# Altium schematic sheet POWER_PMIC_RK809_LDO.SchDoc
size A4; SheetNumber: 6; SheetTotal: 25
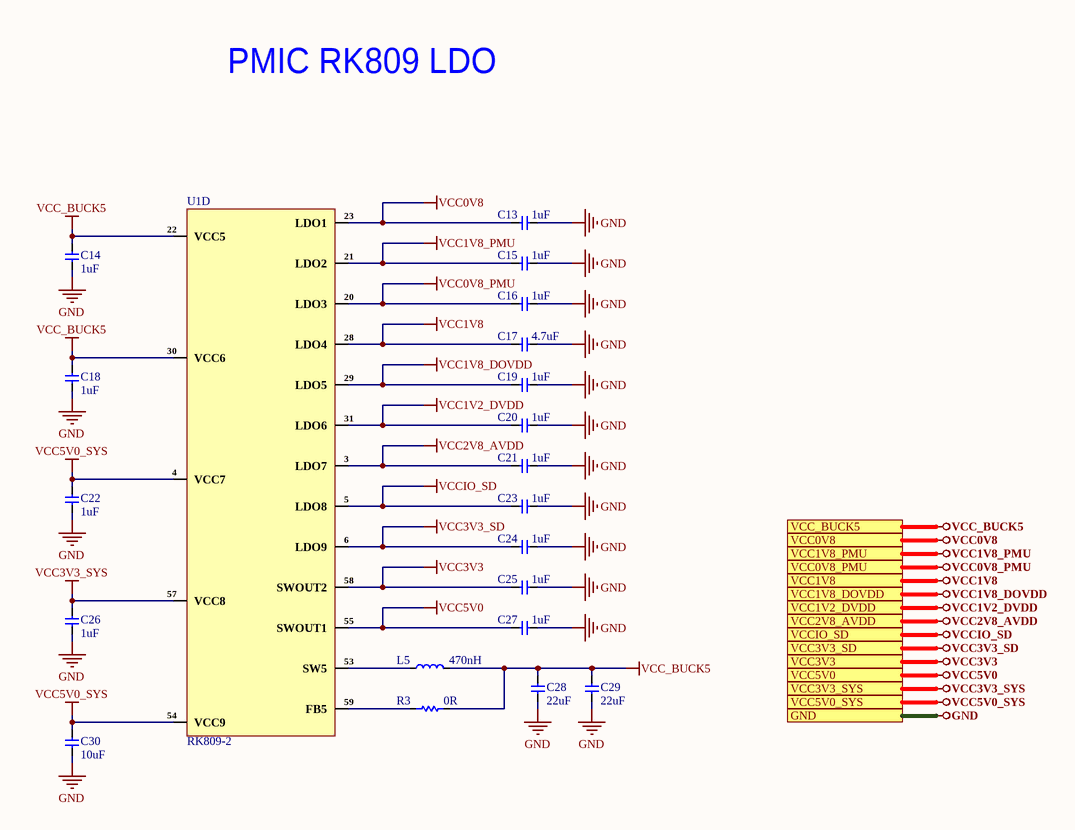
[diagram p0: POWER_PMIC_RK809_LDO.SchDoc]

## Parts
C13  1uF  [Cap-0402]
C14  1uF  [Cap-0402]
C15  1uF  [Cap-0402]
C16  1uF  [Cap-0402]
C17  4.7uF  [Cap-0402]
C18  1uF  [Cap-0402]
C19  1uF  [Cap-0402]
C20  1uF  [Cap-0402]
C21  1uF  [Cap-0402]
C22  1uF  [Cap-0402]
C23  1uF  [Cap-0402]
C24  1uF  [Cap-0402]
C25  1uF  [Cap-0402]
C26  1uF  [Cap-0402]
C27  1uF  [Cap-0402]
C28  22uF  [Cap-0603]
C29  22uF  [Cap-0603]
C30  10uF  [Cap-0603]
L5  470nH  [YHNR3012-R47M]
R3  0R  [Res-0402]
U1  RK809-2  [68-QFN-(7x7)]  (part D of 4)

## Ports
GND (see DDR3_SDRAM_INTERFACE[4D], DIGITAL_MEMS_MIC_INTERFACE[3D], eMMC_INTERFACE[3D], ETHERNET_SWITCH_INTERFACE[5C], IR-CUT_LIGHT SENSOR_SHEET[3D], MIPI TO HDMI_MODULE_INTERFACE[3D], MIPI-CSI_RXX_INTERFACE[4C], PoE PD INTERFACE[3D], PoE_PSE_CONTROLLER[5D], POWER_LDO_SHEET[3D], POWER_PMIC_RK809_CODEC[3D], POWER_PMIC_RK809_DC DC[3D], POWER_PMIC_RK809_MANAGEMENT[3D], RV1126_AUDIO_SHEET[3D], RV1126_DRAM_SHEET[4C], RV1126_eMMC_SPI-FLASH_SHEET[3D], RV1126_ETHERNET_SHEET[3D], RV1126_OSC-PLL-PMUIO[3C], RV1126_POWER_SHEET[1D], RV1126_SARADC_SHEET[3C], SPI_FLASH_INTERFACE[3D], SYNCHRONOUS _BUCK_CONTROLLER[3D], USB2.0_DEBUG_UART[3D], WIFI_AP6256_SHEET[4D]), VCC0V8 (see MIPI TO HDMI_MODULE_INTERFACE[3D], MIPI-CSI_RXX_INTERFACE[4C], USB2.0_DEBUG_UART[3D]), VCC0V8_PMU, VCC1V2_DVDD (see MIPI-CSI_RXX_INTERFACE[4C]), VCC1V8 (see DIGITAL_MEMS_MIC_INTERFACE[3D], IR-CUT_LIGHT SENSOR_SHEET[3D], MIPI TO HDMI_MODULE_INTERFACE[3D], MIPI-CSI_RXX_INTERFACE[4C], POWER_PMIC_RK809_MANAGEMENT[3D], RV1126_AUDIO_SHEET[3D], RV1126_ETHERNET_SHEET[3D], RV1126_OSC-PLL-PMUIO[3C], RV1126_SARADC_SHEET[3C], USB2.0_DEBUG_UART[3D], WIFI_AP6256_SHEET[4D]), VCC1V8_DOVDD (see MIPI-CSI_RXX_INTERFACE[4C]), VCC1V8_PMU (see POWER_PMIC_RK809_MANAGEMENT[3D], RV1126_OSC-PLL-PMUIO[3C]), VCC2V8_AVDD (see MIPI-CSI_RXX_INTERFACE[4C]), VCC3V3 (see RV1126_ETHERNET_SHEET[3D], RV1126_SARADC_SHEET[3C], USB2.0_DEBUG_UART[3D], WIFI_AP6256_SHEET[4D]), VCC3V3_SD, VCC3V3_SYS (see MIPI TO HDMI_MODULE_INTERFACE[3D], POWER_PMIC_RK809_DC DC[3D], POWER_PMIC_RK809_MANAGEMENT[3D], RV1126_eMMC_SPI-FLASH_SHEET[3D], RV1126_OSC-PLL-PMUIO[3C], WIFI_AP6256_SHEET[4D]), VCC5V0, VCC5V0_SYS (see IR-CUT_LIGHT SENSOR_SHEET[3D], MIPI TO HDMI_MODULE_INTERFACE[3D], POWER_LDO_SHEET[3D], POWER_PMIC_RK809_CODEC[3D], POWER_PMIC_RK809_DC DC[3D], POWER_PMIC_RK809_MANAGEMENT[3D], RV1126_OSC-PLL-PMUIO[3C], SYNCHRONOUS _BUCK_CONTROLLER[3D], USB2.0_DEBUG_UART[3D]), VCC_BUCK5 (see POWER_LDO_SHEET[3D]), VCCIO_SD (see RV1126_eMMC_SPI-FLASH_SHEET[3D])

## Nets
GND: C13.1 C14.1 C15.1 C16.1 C17.1 C18.1 C19.1 C20.1 C21.1 C22.1 C23.1 C24.1 C25.1 C26.1 C27.1 C28.1 C29.1 C30.1 ; port GND
VCC0V8: C13.2 U1.23(LDO1) ; port VCC0V8
VCC0V8_PMU: C16.2 U1.20(LDO3) ; port VCC0V8_PMU
VCC1V2_DVDD: C20.2 U1.31(LDO6) ; port VCC1V2_DVDD
VCC1V8: C17.2 U1.28(LDO4) ; port VCC1V8
VCC1V8_DOVDD: C19.2 U1.29(LDO5) ; port VCC1V8_DOVDD
VCC1V8_PMU: C15.2 U1.21(LDO2) ; port VCC1V8_PMU
VCC2V8_AVDD: C21.2 U1.3(LDO7) ; port VCC2V8_AVDD
VCC3V3: C25.2 U1.58(SWOUT2) ; port VCC3V3
VCC3V3_SD: C24.2 U1.6(LDO9) ; port VCC3V3_SD
VCC3V3_SYS: C26.2 U1.57(VCC8) ; port VCC3V3_SYS
VCC5V0: C27.2 U1.55(SWOUT1) ; port VCC5V0
VCC5V0_SYS: C22.2 C30.2 U1.4(VCC7) U1.54(VCC9) ; port VCC5V0_SYS
VCC_BUCK5: C14.2 C18.2 C28.2 C29.2 L5.2 R3.2 U1.22(VCC5) U1.30(VCC6) ; port VCC_BUCK5
VCCIO_SD: C23.2 U1.5(LDO8) ; port VCCIO_SD
NetL5_1: L5.1 U1.53(SW5)
NetR3_1: R3.1 U1.59(FB5)

## Notes on the sheet
- PMIC RK809 LDO
- File:
- Title:
- Date:
- Page
- Num:
- Total:
- Drawn By: Huzaifa Ali

## Library data of the parts
C13-C16 C18-C27 = CC0402KRX5R6BB105: CAP CER 1UF 10V X5R 0402; Manufacturer: Yageo; Tolerance: 10%; Dissipation Factor: 15%; Item Type: Capacitor; Supplier 1: Mouser; Manufacturer Part Number: CC0402KRX5R6BB105; RoHS: Yes; Category: Ceramic Capacitors; Stock 1: 6711367; Pricing 1: 1=0.11000, 10=0.05500, 50=0.05500, 100=0.03300, 500=0.02700, 1000=0.02200, 2500=0.02100, 10000=0.01800 (USD); Mount: Surface Mount; Case/Package: 0402; Number of Pins: 2; Case Code (Metric): 1005; Case Code (Imperial): 0402; Min Operating Temperature: -55°C; Max Operating Temperature: 85°C; Capacitance: 1uF; Dielectric: X5R; Package Quantity: 1; Voltage Rating: 10V; Packaging: Tape and Reel; Voltage Rating (DC): 10V; Termination: SMD/SMT; Resistor Type: Ceramic; Series: CC; Construction: Flat; Length: 1mm; Width: 0.02inch; Height: 0.5mm; Thickness: 0.022inch; Depth: 0.5mm; Radiation Hardening: No; REACH SVHC: No SVHC; Lead Free: Lead Free; Halogen Free: Halogen Free; RoHS Compliant: Yes; ComponentLink1URL: https://datasheet.ciiva.com/176/upy-gphc-x5r-4v-to-50v-12-176704.pdf?src-supplier=Digi-Key; ComponentLink1Description: https://datasheet.ciiva.com/176/upy-gphc-x5r-4v-to-50v-12-176704.pdf?src-supplier=Digi-Key; ComponentLink2URL: https://datasheet.ciiva.com/176/mlccorderingcode-176705.pdf?src-supplier=Digi-Key; ComponentLink2Description: https://datasheet.ciiva.com/176/mlccorderingcode-176705.pdf?src-supplier=Digi-Key; ComponentLink3URL: https://datasheet.ciiva.com/176/mlccorderingcode-176706.pdf?src-supplier=Digi-Key; ComponentLink3Description: https://datasheet.ciiva.com/176/mlccorderingcode-176706.pdf?src-supplier=Digi-Key; Supplier Part Number 1: 603-CC402KRX5R6BB105; LCSC Part Number: C106254
C17 = CC0402KRX5R5BB475: CAP CER 4.7UF 6.3V X5R 0402; Manufacturer: Yageo; Tolerance: 10%; Item Type: Capacitor; Supplier 1: Arrow Electronics; Manufacturer Part Number: CC0402KRX5R5BB475; RoHS: Yes; Category: Ceramic Capacitors; Stock 1: 890000; Pricing 1: 10000=0.02120, 20000=0.02030, 30000=0.02010, 50000=0.01930, 100000=0.01760, 250000=0.01630 (USD); Case/Package: 0402; Voltage Rating (DC): 6.3V; Dielectric: X5R; Capacitance: 4.7uF; Lead Free: Lead Free; Halogen Free: Halogen Free; RoHS Compliant: Yes; ComponentLink1URL: http://www.yageo.com/documents/recent/UPY-GPHC_X5R_4V-to-50V_25.pdf?src-supplier=Digi-Key; ComponentLink1Description: http://www.yageo.com/documents/recent/UPY-GPHC_X5R_4V-to-50V_25.pdf?src-supplier=Digi-Key; ComponentLink2URL: https://www.yageo.com/upload/media/product/productsearch/datasheet/mlcc/UPY-GPHC_X5R_4V-to-50V_26.pdf?src-supplier=Digi-Key; ComponentLink2Description: https://www.yageo.com/upload/media/product/productsearch/datasheet/mlcc/UPY-GPHC_X5R_4V-to-50V_26.pdf?src-supplier=Digi-Key; LCSC Part Number: C541466; Supplier Part Number 1: CC0402KRX5R5BB475
C28 C29 = CC0603MRX5R5BB226: CAP CER 22UF 6.3V X5R 0603; Manufacturer: Yageo; Tolerance: 20%; Supplier 1: Mouser; Manufacturer Part Number: CC0603MRX5R5BB226; RoHS: Yes; Category: Ceramic Capacitors; Stock 1: 3030; Pricing 1: 1=0.33000, 10=0.22500, 50=0.22500, 100=0.12800, 1000=0.07900, 10000=0.06500 (USD); Mount: Surface Mount; Case/Package: 0603; Case Code (Metric): 1608; Case Code (Imperial): 0603; Weight: 7.1E-05oz; Min Operating Temperature: -55°C; Max Operating Temperature: 85°C; Capacitance: 22uF; Packaging: Tape and Reel; Dielectric: X5R; Voltage Rating: 6.3V; Termination: SMD/SMT; Resistor Type: Ceramic; Voltage Rating (DC): 6.3V; Package Quantity: 4000; Length: 0.063inch; Width: 0.031inch; Thickness: 0.035inch; Depth: 0.8mm; Lead Free: Lead Free; Halogen Free: Halogen Free; RoHS Compliant: Yes; ComponentLink1URL: http://www.mouser.com/ds/2/447/Yageo_UPY-GP_NP0_16V-to-50V_9-358835.pdf?src-supplier=Mouser; ComponentLink1Description: http://www.mouser.com/ds/2/447/Yageo_UPY-GP_NP0_16V-to-50V_9-358835.pdf?src-supplier=Mouser; ComponentLink2URL: http://www.yageo.com/documents/recent/UPY-GPHC_X5R_4V-to-50V_25.pdf?src-supplier=Digi-Key; ComponentLink2Description: http://www.yageo.com/documents/recent/UPY-GPHC_X5R_4V-to-50V_25.pdf?src-supplier=Digi-Key; Supplier Part Number 1: 603-CC603MRX5R5BB226; LCSC Part Number: C109448
C30 = CC0603KRX5R6BB106: CAP CER 10UF 10V X5R 0603; Manufacturer: Yageo; Tolerance: 10%; Item Type: Capacitor; Supplier 1: Digi-Key; Manufacturer Part Number: CC0603KRX5R6BB106; RoHS: Yes; Category: Ceramic Capacitors; Stock 1: 187515; Pricing 1: 1=0.24000, 10=0.16300, 50=0.09780, 100=0.08260, 500=0.05654, 1000=0.05001 (USD); Mount: Surface Mount; Case/Package: 0603; Case Code (Metric): 1608; Case Code (Imperial): 0603; Weight: 7.1E-05oz; Min Operating Temperature: -55°C; Max Operating Temperature: 85°C; Capacitance: 10uF; Packaging: Tape and Reel; Dielectric: X5R; Voltage Rating: 10V; Termination: SMD/SMT; Resistor Type: Ceramic; Voltage Rating (DC): 10V; Package Quantity: 4000; Length: 0.063inch; Width: 0.031inch; Thickness: 0.035inch; Depth: 0.8mm; Lead Free: Lead Free; Halogen Free: Halogen Free; RoHS Compliant: Yes; ComponentLink1URL: http://www.mouser.com/ds/2/447/Yageo_UPY-GP_NP0_16V-to-50V_9-358835.pdf?src-supplier=Mouser; ComponentLink1Description: http://www.mouser.com/ds/2/447/Yageo_UPY-GP_NP0_16V-to-50V_9-358835.pdf?src-supplier=Mouser; ComponentLink2URL: http://www.yageo.com/documents/recent/UPY-GPHC_X5R_4V-to-50V_25.pdf?src-supplier=Digi-Key; ComponentLink2Description: http://www.yageo.com/documents/recent/UPY-GPHC_X5R_4V-to-50V_25.pdf?src-supplier=Digi-Key; Supplier Part Number 1: 311-1782-1-ND; LCSC Part Number: C326057
L5 = YHNR3012-R47M: 4.2A 470nH 合金磁胶电感 ±20% 8A SMD,3x3mm Power Inductors ROHS; Manufacturer: YJYCOIN; Manufacturer Part Number: YHNR3012-R47M; Package: SMD,3x3mm; LCSC Part Number: C20416183; Item Type: Inductor; ComponentLink1Description: LCSC; ComponentLink1URL: https://www.lcsc.com/product-detail/Power-Inductors_YJYCOIN-YHNR3012-R47M_C20416183.html
R3 = RC0402FR-070RL: RES 0 OHM JUMPER 1/16W 0402; Manufacturer: Yageo; Tolerance: 1%; Power Rating: 62.5mW; Voltage Rating: 50V; Temperature Coefficient: 200ppm/°C; Max Power Dissipation: 63mW; Supplier 1: Mouser; Manufacturer Part Number: RC0402FR-070RL; RoHS: Yes; Category: Chip SMD Resistors; Stock 1: 8556842; Pricing 1: 1=0.10000, 10=0.01400, 50=0.01400, 100=0.00600, 1000=0.00300, 5000=0.00200, 10000=0.00100 (USD); Mount: Surface Mount; Case/Package: 0402; Contact Plating: Tin,Matte; Case Code (Imperial): 0402; Case Code (Metric): 1005; Size Code: 0402; Min Operating Temperature: -55°C; Max Operating Temperature: 155°C; Resistance: 0R; Resistor Type: Thick Film; Packaging: Tape and Reel; Termination: SMD/SMT; Features: Moisture Resistant; Series: RC; Number of Terminations: 2; Length: 1mm; Width: 0.5mm; Height: 0.35mm; Radiation Hardening: No; Lead Free: Lead Free; RoHS Compliant: Yes; ComponentLink1URL: https://datasheet.ciiva.com/8896/pyu-rc0402-51-rohs-l-6-8896149.pdf?src-supplier=Avnet; ComponentLink1Description: https://datasheet.ciiva.com/8896/pyu-rc0402-51-rohs-l-6-8896149.pdf?src-supplier=Avnet; ComponentLink2URL: https://datasheet.ciiva.com/16790/pyu-rc0402-51-rohs-l-6-r-16790444.pdf?src-supplier=Future+Electronics; ComponentLink2Description: https://datasheet.ciiva.com/16790/pyu-rc0402-51-rohs-l-6-r-16790444.pdf?src-supplier=Future+Electronics; Supplier Part Number 1: 603-RC0402FR-070RL; LCSC Part Number: C106231
U1 = RK809-2: QFN-68-EP(7x7) Power Management Specialized - PMIC ROHS; Manufacturer: Rockchip; Item Type: IC; Manufacturer Part Number: RK809-2; Package: QFN-68-EP(7x7); LCSC Part Number: C2940552; ComponentLink1Description: LCSC; ComponentLink1URL: https://www.lcsc.com/product-detail/Power-Management-Specialized-PMIC_Rockchip-RK809-2_C2940552.html